# Altium schematic sheet S2_Power.SchDoc
size 420 x 297 mm; SheetNumber: 2; SheetTotal: 11
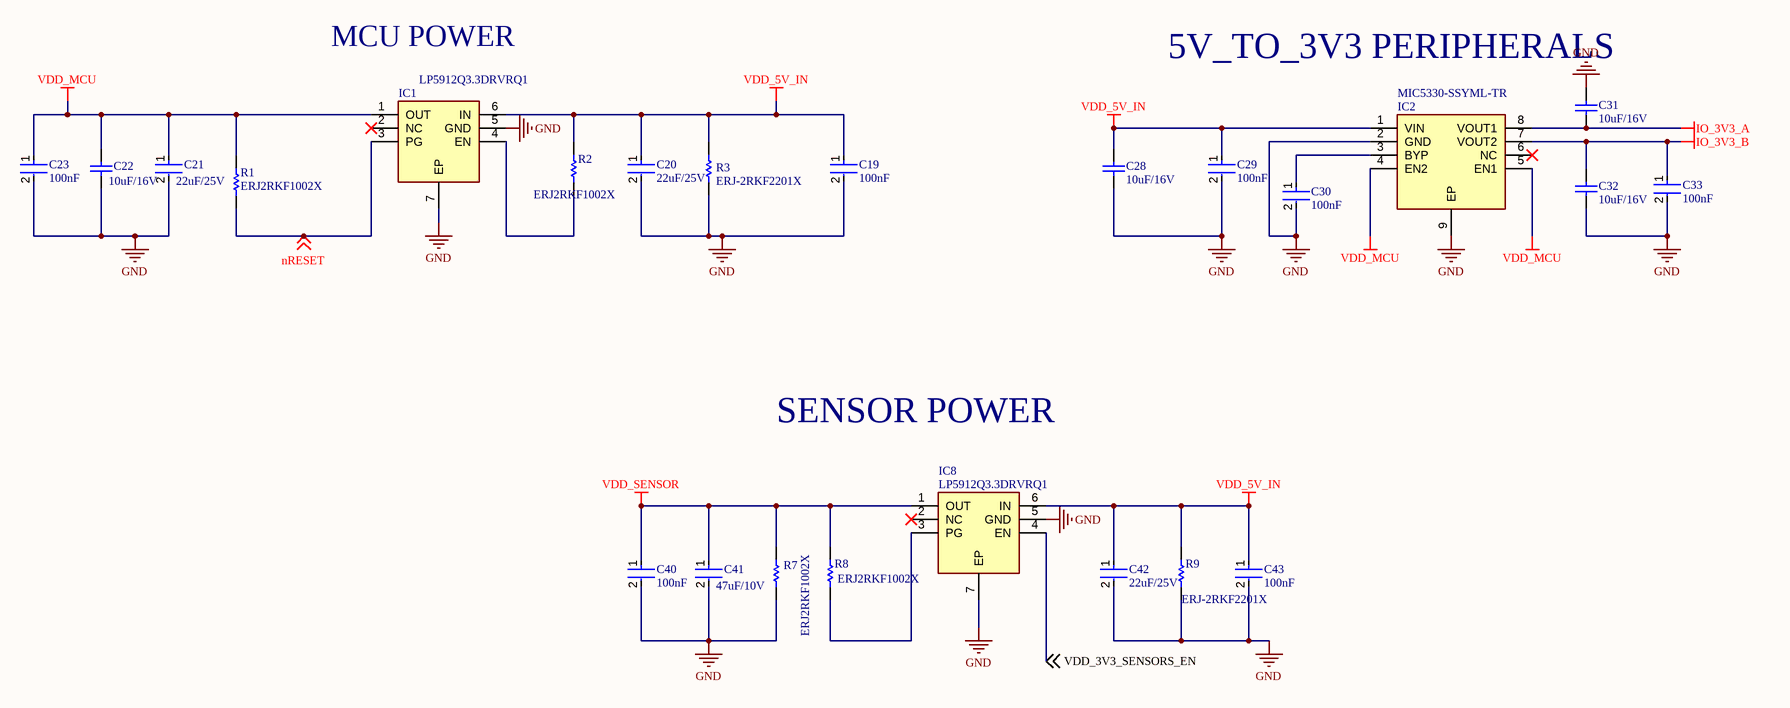
[diagram p0: S2_Power.SchDoc]

## Parts
C19  100nF  [FP-CC0402-MFG]
C20  22uF/25V  [FP-MK325M-MFG]
C21  22uF/25V  [FP-MK325M-MFG]
C22  10uF/16V  [CAPC1210(3225)210_L]
C23  100nF  [FP-CC0402-MFG]
C28  10uF/16V  [CAPC1210(3225)210_L]
C29  100nF  [FP-CC0402-MFG]
C30  100nF  [FP-CC0402-MFG]
C31  10uF/16V  [CAPC1210(3225)210_L]
C32  10uF/16V  [CAPC1210(3225)210_L]
C33  100nF  [FP-CC0402-MFG]
C40  100nF  [FP-CC0402-MFG]
C41  47uF/10V  [FP-C2012-125-0_2-IPC_B]
C42  22uF/25V  [FP-MK325M-MFG]
C43  100nF  [FP-CC0402-MFG]
IC1  LP5912Q3.3DRVRQ1  [SON65P200X200X80-7N]
IC2  MIC5330-SSYML-TR  [SON50P200X200X95-9N-D]
IC8  LP5912Q3.3DRVRQ1  [SON65P200X200X80-7N]
R1  ERJ2RKF1002X  [RESC1005X40X25LL05T05]
R2  ERJ2RKF1002X  [RESC1005X40X25LL05T05]
R3  ERJ-2RKF2201X  [RESC1005X40X25LL05T05]
R7  ERJ2RKF1002X  [RESC1005X40X25LL05T05]
R8  ERJ2RKF1002X  [RESC1005X40X25LL05T05]
R9  ERJ-2RKF2201X  [RESC1005X40X25LL05T05]

## Nets
GND: C19.2 C20.2 C21.2 C22.1 C23.2 C28.1 C29.2 C30.2 C31.1 C32.1 C33.2 C40.2 C41.2 C42.2 C43.2 IC1.5(GND) IC1.7(EP) IC2.2(GND) IC2.9(EP) IC8.5(GND) IC8.7(EP) R3.1 R7.1 R9.1
IO_3V3_A: C31.2 IC2.8(VOUT1)
IO_3V3_B: C32.2 C33.1 IC2.7(VOUT2)
VDD_5V_IN: C19.1 C20.1 C28.2 C29.1 C42.1 C43.1 IC1.6(IN) IC2.1(VIN) IC8.6(IN) R2.2 R3.2 R9.2
VDD_MCU: C21.1 C22.2 C23.1 IC1.1(OUT) IC2.4(EN2) IC2.5(EN1) R1.2
VDD_SENSOR: C40.1 C41.1 IC8.1(OUT) R7.2 R8.2
nRESET: IC1.3(PG) R1.1 ; off-sheet nRESET
VDD_3V3_SENSORS_EN: IC8.4(EN) ; off-sheet VDD_3V3_SENSORS_EN
NetC30_1: C30.1 IC2.3(BYP)
NetIC1_4: IC1.4(EN) R2.1
NetIC8_3: IC8.3(PG) R8.1

Not connected (* = marked no-connect by the designer): IC1 2(NC)*; IC2 6(NC)*; IC8 2(NC)*

## Notes on the sheet
- MCU POWER
- 5V_TO_3V3 PERIPHERALS
- SENSOR POWER
- THIS DOCUMENT AND THE DATA DISCLOSED HEREIN OR
- HEREWITH IS THE PROPERTY OF ALTIUM LIMITED AND MAY
- DWG NO:
- REVISION
- REV:
- DESCRIPTION
- DATE
- APPROVED
- BE FREELY DISTRIBUTED IN WHOLE. NO RIGHTS ARE
- RESERVED OR EXPRESS OR IMPLIED WARANTEE GIVEN.
- ENG:
- APPROVALS
- PROJECT
- DSN:
- CHK:
- REFERENCE DOCUMENTS
- PROJECT REVISION:
- TITLE
- DOCUMENT REVISION:
- DESIGN ITEM:
- BOM:
- FAB DWG:
- PCB DWG:
- ASSY DWG:
- SCALE:
- A3
- SIZE
- CAGE CODE
- FILE NAME
- DWG NO.
- SHEET
- OF
- REV

## Library data of the parts
C19 C23 C29 C30 C33 C40 C43 = CMP-03422-001121-1: CAP CER 0.1UF 16V X7R 0402; Manufacturer: YAGEO; Manufacturer Part Number: CC0402KPX7R7BB104; Material: Ceramic; Temperature Coefficient: 30ppm/°C; Automotive Grade: NA; Tolerance: 0.1; Digikey Description: CAP CER 0.1UF 16V X7R 0402; Temperature Range Low: -55°C; Footprint Url: http://www.yageo.com/exep/pages/download/literatures/UPY-C_GEN_24.pdf; RoHS: TRUE; Device Class L3: Ceramic Capacitors; Temperature Characteristic: X7R; Capacitance: 100 nF; Package: CC0402; Device Class L1: Passive Components; Lead Free: Yes; Temperature Range High: +125°C; Category: Cap; Mouser Description: 0402 0.1 uF 16 V ±10% Tolerance X7R SMT Multilayer Ceramic Capacitor; Voltage Rating: 16 V; Value: 100 nF; ComponentLink2Description: Datasheet; Automotive: No; Octopart: https://octopart.com/cc0402kpx7r7bb104-yageo-21548559; ComponentLink2URL: http://www.yageo.com/documents/recent/UPY-GP_NP0_16V-to-50V_16.pdf; Height: 0.55mm; Device Class L2: Capacitors; Temperature: -55°C to +125°C; Ipc Land Pattern Name: CAPC10050X50
C20 C21 C42 = CMP-14477-000145-1: CAP CER 22UF 25V X5R 1210; Tolerance: 20%; Width: 0.098inch; Thickness: 0.106inch; Depth: 2.5mm; Packaging: Tape and Reel; Max Operating Temperature: 85°C; Termination: SMD/SMT; Case Code (Imperial): 1210; Height: 2.5mm; Case/Package: 1210; Voltage Rating: 25V; Package Quantity: 1; Min Operating Temperature: -55°C; Capacitance: 22uF; Halogen Free: Halogen Free; Case Code (Metric): 3225; Mount: Surface Mount; Construction: Flat; Radiation Hardening: No; Length: 3.2mm; Voltage Rating (DC): 25V; Contact Plating: Nickel; Number of Pins: 2; Dielectric: X5R; RoHS Compliant: Yes; Resistor Type: Ceramic; Series: M
C22 C28 C31 C32 = CMP-1038-02215-1: CAP 10uF 16V ±20% 1210 (3225 Metric) Thickness 2.1mm SMD; Case-EIA: 1210; Tolerance: Â±20%; Case-Metric: 3225; Max Thickness: 2.1 mm; Rated Voltage: 16 V; Value: 10uF; Technology: SMT
C41 = CMP-2000-05451-2: Multilayer Ceramic Capacitors 47μF ±20% 10V X5R SMD 0805; Capacitance: 47uF; RoHS Compliant: Yes; Dielectric: X5R; Case Code (Imperial): 0805; Min Operating Temperature: -55°C; Length: 2mm; Voltage Rating: 10V; Lead Free: Lead Free; Weight: 0.000194oz; Resistor Type: Ceramic; Dielectric Material: Ceramic; Max Operating Temperature: 85°C; Height: 1.25mm; Width: 0.049inch; Depth: 1.25mm; Termination: SMD/SMT; Case/Package: 0805; Voltage Rating (DC): 10V; Voltage: 10V; Thickness: 0.057inch; Tolerance: 20%; REACH SVHC: No SVHC; Package Quantity: 1; Series: C; Case Code (Metric): 2012; Mount: Surface Mount; Packaging: Tape and Reel
IC1 IC8 = LP5912Q3.3DRVRQ1: Integrated Circuit; Manufacturer_Name: Texas Instruments; Datasheet Link: http://www.ti.com/lit/gpn/lp5912-q1; Height: 0.8mm; Manufacturer_Part_Number: LP5912Q3.3DRVRQ1; Mouser Part Number: 595-LP5912Q3.3DRVRQ1; Mouser Price/Stock: https://www.mouser.co.uk/ProductDetail/Texas-Instruments/LP5912Q3.3DRVRQ1?qs=n%252BTO0c4TDSb%252BK5JhyfAoLw%3D%3D
IC2 = MIC5330-SSYML-TR: Integrated Circuit; Manufacturer_Name: Microchip; Datasheet Link: http://www.microchip.com/mymicrochip/filehandler.aspx?ddocname=en579824; Height: 0.95mm; Manufacturer_Part_Number: MIC5330-SSYML-TR; Mouser Part Number: 998-MIC5330-SSYMLTR; Mouser Price/Stock: https://www.mouser.co.uk/ProductDetail/Microchip-Technology/MIC5330-SSYML-TR?qs=U6T8BxXiZAVlV%252Bccuslf5g%3D%3D; Arrow Part Number: MIC5330-SSYML-TR; Arrow Price/Stock: https://www.arrow.com/en/products/mic5330-ssyml-tr/microchip-technology?region=nac
R1 R2 R7 R8 = CMP-2000-07588-1: Chip Resistor, 10 KOhm, +/- 1%, 0.1 W, -55 to 155 degC, 0402 (1005 Metric), RoHS, Tape and Reel; Manufacturer: Panasonic; Power Rating: 100mW; Voltage Rating: 50V; Resistance: 10KOhm; Case\/Package: 0402; Temperature Coefficient: 100ppm\/degreesC; RoHSCompliant: True; Lead Free: LeadFree; Package Quantity: 1; Contact Plating: Tin; Length: 1mm; Radiation Hardening: No; REACH SVHC: NoSVHC; Max Operating Temperature: 155degC; Depth: 0.5mm; Case Code (Imperial): 0402; Military Standard: Not; Package Description: 2-Pin Surface Mount Device, Body 1 x 0.5 mm; Termination: SMD/SMT; Case Code (Metric): 1005; Height: 0.35mm; Packaging: TapeandReel; Voltage Rating (DC): 50V; Package Reference: 402; Number of Pins: 2; Tolerance: 1%; Mounting Technology: SurfaceMount; Width: 0.02inch; Mount: SurfaceMount; Datasheet URL: https://industrial.panasonic.com/cdbs/www-data/pdf/RDA0000/AOA0000C304.pdf; Composition: ThickFilm; Datasheet Version: 02/2017; Manufacturer URL: http://www.panasonic.com/; Max Power Dissipation: 100mW; Number of Terminations: 2; Min Operating Temperature: -55degC
R3 R9 = CMP-2002-01132-2: Precision Thick Film Chip Resistor, 2.2 kOhm, 100 mW, 1%, -55 to 155 degC, 2-Pin SMD (0402), RoHS, Tape and Reel; Manufacturer: Panasonic; Resistance: 2.2kO; Temp Coefficient: ±100ppm/°C; Rated Power: 0.1W; Datasheet URL: https://datasheet.ciiva.com/11821/0900766b80f80784-11821273.pdf; Tolerance (%): ±1%; Mounting Technology: SurfaceMount; Package Description: 2-Pin Surface Mount Device, Body 1 x 0.5 mm; Manufacturer URL: http://www.panasonic.com/; Datasheet Version: 03/2011; Package Reference: 0402; Size Code: 0402